# Altium project CONTROL_SSM.PrjPcb
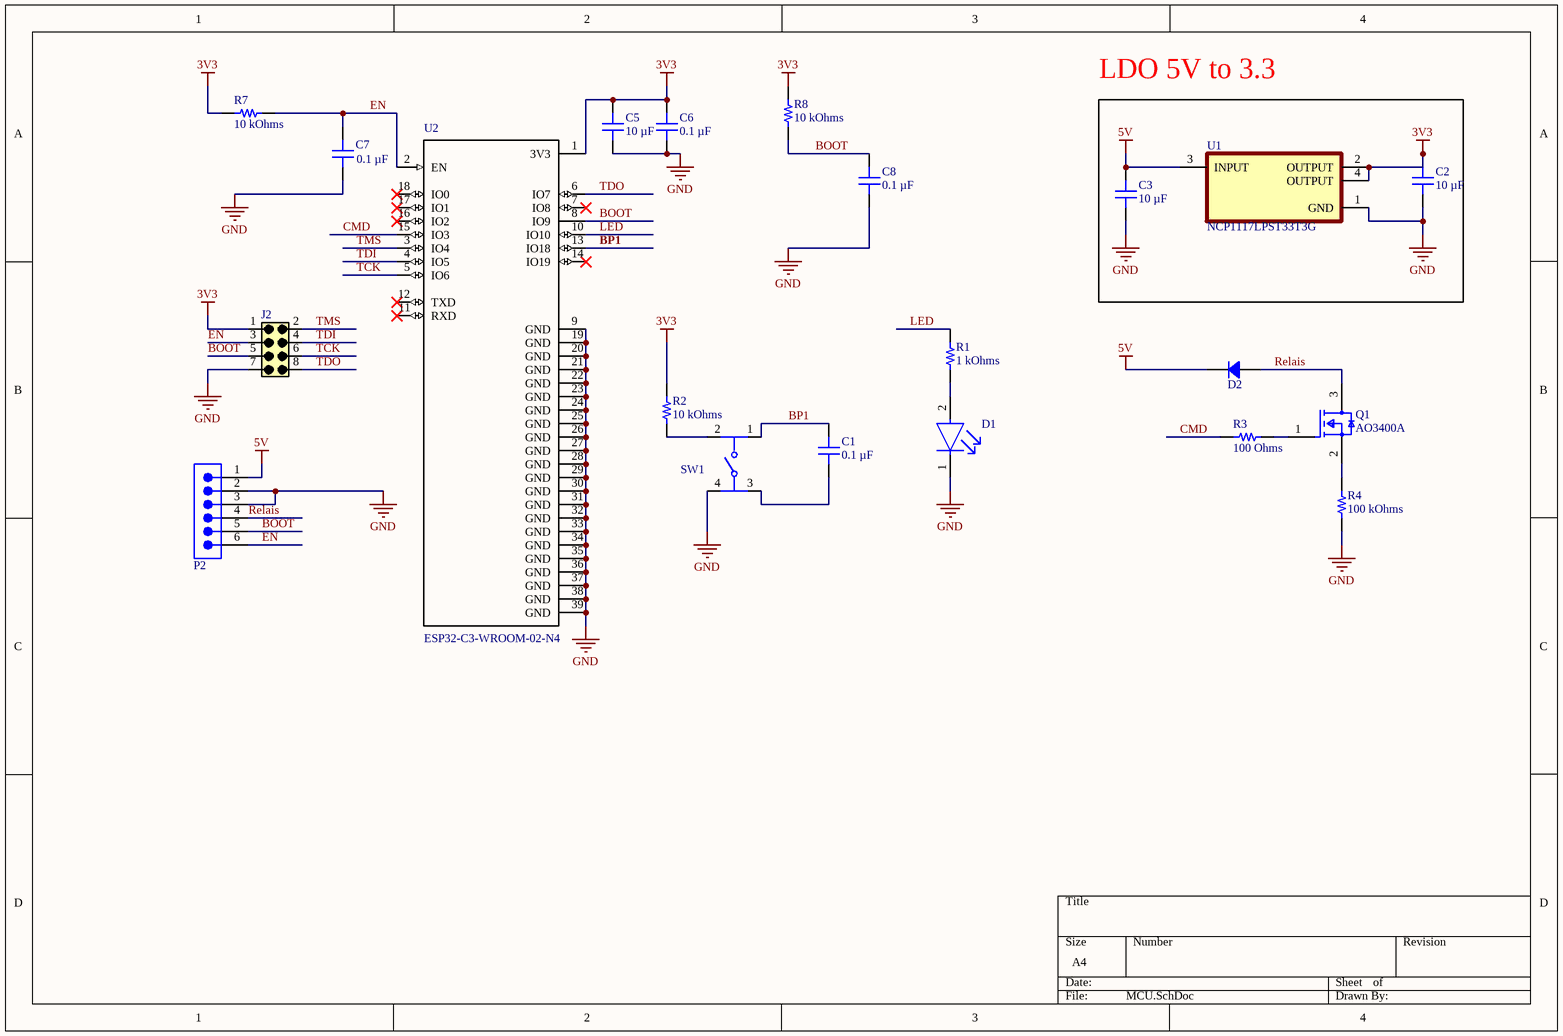
[diagram p0: MCU.SchDoc]
1 sheet, 21 parts. Net scope: global (net labels, ports and power ports of the same name join across sheets).
Board file: PCB_LV.PcbDoc

## Sheet MCU.SchDoc
size A4; SheetNumber: 1; SheetTotal: 1

### Parts
C1  Capacitance: 0.1 µF  [CAP 0402_1005]
C2  10 µF  [CAP 0603_1608]
C3  10 µF  [CAP 0603_1608]
C5  Capacitance: 10 µF  [CAP 0603_1608]
C6  Capacitance: 0.1 µF  [CAP 0402_1005]
C7  Capacitance: 0.1 µF  [CAP 0402_1005]
C8  Capacitance: 0.1 µF  [CAP 0402_1005]
D1  SML-P11DTT86R  [FP-SML-P11-MFG]  (value not drawn)
D2  1N4007FLTR  [SOD123F]  (value not drawn)
J2  6130XX21121_61300821121  [61300821121]  (value not drawn)
P2  TSW-106-08-F-S-RA  [SMTC-TSW-106-08-X-S-RA]  (value not drawn)
Q1  AO3400A  [FP-SOT23-MFG]
R1  1 kOhms  [RES 0402_1005]
R2  10 kOhms  [RES 0402_1005]
R3  100 Ohms  [RES 0402_1005]
R4  100 kOhms  [RES 0402_1005]
R7  10 kOhms  [RES 0402_1005]
R8  10 kOhms  [RES 0402_1005]
SW1  1301.9320  [FP-1301_9320-MFG]  (value not drawn)
U1  NCP1117LPST33T3G  [SOT230P700X175-4N]
U2  ESP32-C3-WROOM-02-N4  [*MODULE_ESP32-C3-WROOM-02-H4]

### Blocks framed on the sheet
LDO 5V to 3.3: C2 C3 U1

### Nets
3V3: C2.2 C5.1 C6.2 J2.1 R2.2 R7.2 R8.2 U1.2(OUTPUT) U1.4(OUTPUT) U2.1(3V3)
5V: C3.2 D2.2 P2.1 U1.3(INPUT)
GND: C2.1 C3.1 C5.2 C6.1 C7.1 C8.1 D1.1(C) J2.7 P2.2 P2.3 R4.1 SW1.4 U1.1(GND) U2.9(GND) U2.19(GND) U2.20(GND) U2.21(GND) U2.22(GND) U2.23(GND) U2.24(GND) U2.25(GND) U2.26(GND) U2.27(GND) U2.28(GND) U2.29(GND) U2.30(GND) U2.31(GND) U2.32(GND) U2.33(GND) U2.34(GND) U2.35(GND) U2.36(GND) U2.37(GND) U2.38(GND) U2.39(GND)
BOOT: C8.2 J2.5 P2.5 R8.1 U2.8(IO9)
BP1: C1.2 SW1.1 U2.13(IO18)
CMD: R3.1 U2.15(IO3)
EN: C7.2 J2.3 P2.6 R7.1 U2.2(EN)
LED: R1.2 U2.10(IO10)
Relais: D2.1 P2.4 Q1.3(D)
TCK: J2.6 U2.5(IO6)
TDI: J2.4 U2.4(IO5)
TDO: J2.8 U2.6(IO7)
TMS: J2.2 U2.3(IO4)
NetC1_1: C1.1 SW1.3
NetD1_2: D1.2(A) R1.1
NetQ1_1: Q1.1(G) R3.2
NetQ1_2: Q1.2(S) R4.2
NetR2_1: R2.1 SW1.2

Not connected (* = marked no-connect by the designer): U2 7(IO8)* 11(RXD)* 12(TXD)* 14(IO19)* 16(IO2)* 17(IO1)* 18(IO0)*

### Library data of the parts
C1 C6-C8 = CC0402MRX5R5BB104: CAP CER 0.1UF 6.3V X5R 0402; Part Number: CC0402MRX5R5BB104
C2 C3 = GMC10X7R106M6R3NT: CAP0603 X7R 10UF 20% 6.3V; manufacturer: Cal-Chip Electronics, Inc.; Part Number: GMC10X7R106M6R3NT; Capacitance: 10 µF; Applications: General Purpose; componentlink1description: Datasheet; componentlink1url: https://88ce57.p3cdn1.secureserver.net/wp-content/uploads/2023/01/gmc_series-2.pdf; componentlink2description: DigiKey Link; componentlink2url: https://www.digikey.com/en/products/detail/cal-chip-electronics-inc/GMC10X7R106M6R3NT/18151153; Device Package: 0603 (1608 Metric); lastupdated: 06/04/2026 7:21:43 PM; Lifecycle Status: Active; Minimum Order: 1; Mounting Type: Surface Mount, MLCC; Operating Temperature: -55°C ~ 125°C; Package / Case: 0603 (1608 Metric); packaging: TapeAndReel; partid: 49831; Part Status: Active; price: 0.09; series: GMC; Size / Dimension: 0.063" L x 0.031" W (1.60mm x 0.80mm); Supplier 1: DigiKey; Supplier Part Number 1: 4713-GMC10X7R106M6R3NTCT-ND; Temperature Coefficient: X7R; Thickness (Max): 0.039" (1.00mm); Tolerance: ±20%; value: 10 µF; Voltage - Rated: 6.3V
C5 = GRT188R61A106KE13D: CAP CER 10UF 10V X5R 0603; Part Number: GRT188R61A106KE13D
D1 = CMP-08952-000022-1: LED ORANGE CLEAR 1006 SMD; Manufacturer: Rohm; Forward Current: 1mA; Wavelength: 605nm; Reverse Voltage: 5V; Power Dissipation: 52mW; Led Orientation: Top View; Luminous Intensity: 7.3mcd; Forward Voltage: 1.9V; Mouser Description: LED Uni-Color Orange 2-Pin Chip 0402(1006Metric) T/R; RoHS: TRUE; Temperature: -40°C to +85°C; Package: SML-P11; Manufacturer Part Number: SML-P11DTT86R; Automotive: No; Digikey Description: LED ORANGE CLEAR 1006 SMD; Lead Free: Yes; Octopart: https://octopart.com/sml-p11dtt86r-rohm-34112313; Temperature Range Low: -40°C; Device Class L2: LEDs; Device Class L3: unset; Height: 0.25mm; Temperature Range High: +85°C; Device Class L1: Optoelectronics; ComponentLink2URL: https://d1d2qsbl8m0m72.cloudfront.net/en/products/databook/datasheet/opto/led/chip_mono/sml-p11-e.pdf; Colour: Orange; Category: Diode; ComponentLink2Description: Datasheet
D2 = 1N4007FLTR: STANDARD RECTIFIER 1000V SOD-123; Part Number: 1N4007FLTR
J2 = 6130XX21121_61300821121: Connector Header Through Hole 8 position 0.100 (2.54mm); MF: Wurth Electronics; SnapEDA_Link: https://www.snapeda.com/parts/61300821121/Wurth+Electronics/view-part/?ref=snap; Package: None; Value: *; MP: 61300821121; Check_prices: https://www.snapeda.com/parts/61300821121/Wurth+Electronics/view-part/?ref=eda
P2 = CMP-1024-00389-1: 0.025" SQ Post Header, Through-hole, Right Angle, -55 to 125 degC, 2.54 mm Pitch, 6-Pin, Male, RoHS; Manufacturer: Samtec; Pitch: 2.54 mm; System: Connector; DatasheetVersion: F-214; PartNumber: TSW-106-08-F-S-RA; PackageDescription: .025[0.64] SQ. Post Terminal Strip Assembly; ComponentLink1Description: Manufacturer URL; ComponentLink2Description: Datasheet; PackageReference: TSW-106-08-X-S-RA; Mounting Technology: Through-hole; ComponentLink1URL: http://www.samtec.com; ComponentLink2URL: http://www.samtec.com/documents/webfiles/pdf/TSW_TH.PDF; Orientation: Right Angle; ComponentLink3URL: http://www.samtec.com/documents/webfiles/cpdf/TSW-XXX-XX-XXX-X-XX-XXX-MKT.pdf; PackageVersion: DM, 8/1988; Temperature Range: -55 to 125 degC; RoHS: True; ComponentLink3Description: Package Specification
Q1 = CMP-83955-000006-1: MOSFET N-CH 30V 5.7A SOT23; Input Capacitance: 630pF; Number of Elements: 1; Rds On Max: 26.5mR; Max Power Dissipation: 1.4W; Gate to Source Voltage (Vgs): 12V; Min Operating Temperature: -55°C; Lead Free: Lead Free; Number of Pins: 3; Drain to Source Voltage (Vdss): 30V; Case/Package: SOT-23; Mount: Surface Mount; Continuous Drain Current (ID): 5.7A; Radiation Hardening: No; Packaging: Tape and Reel; Max Operating Temperature: 150°C; Power Dissipation: 1.4W
R1 = TNPU04021K00BZEP00: TNPU0402 1K0 0.1% T-16 EP1 E3; Manufacturer: Vishay Dale; Power (Watts): 0.063W, 1/16W; Temperature Coefficient: ±5ppm/°C; Part Number: TNPU04021K00BZEP00; Value: 1 kOhms; ComponentLink1Description: Datasheet; ComponentLink1URL: http://www.vishay.com/docs/28779/tnpue3.pdf; ComponentLink2Description: DigiKey Link; ComponentLink2URL: https://www.digikey.com/en/products/detail/vishay-dale/TNPU04021K00BZEP00/10668523; Composition: Thin Film; Device Package: 0402 (1005 Metric); Features: Anti-Sulfur, Automotive AEC-Q200, Moisture Resistant; Height - Seated (Max): 0.016" (0.40mm); LastUpdated: 09/02/2024 8:29:39 PM; Lifecycle Status: Active; Minimum Order: 1; Number of Terminations: 2; Operating Temperature: -55°C ~ 125°C; Package / Case: 0402 (1005 Metric); Packaging: TapeAndReel; PartId: 49940; Part Status: Active; Price: 0.67; Ratings: AEC-Q200; Resistance: 1 kOhms; Series: TNPU e3; Size / Dimension: 0.039" L x 0.020" W (1.00mm x 0.50mm); Supplier 1: DigiKey; Supplier Part Number 1: 541-TNPU04021K00BZEP00CT-ND; Supplier Device Package: 0402; Tolerance: ±0.1%
R2 R7 R8 = TNPU040210K0BZEP00: TNPU0402 10K 0.1% T-16 EP1 E3; Part Number: TNPU040210K0BZEP00; Value: 10 kOhms
R3 = TNPU0402100RBZEP00: TNPU0402 100R 0.1% T-16 EP1 E3; Part Number: TNPU0402100RBZEP00; Value: 100 Ohms
R4 = TNPU0402100KBZEP00: TNPU0402 100K 0.1% T-16 EP1 E3; Part Number: TNPU0402100KBZEP00; Value: 100 kOhms
SW1 = CMP-26321-000001-1: SWITCH TACTILE SPST-NO 0.05A 12V; Manufacturer: Schurter; Electromechanical Life: 100000Cycles; Contact Current Rating: 50mA; Contact Resistance: 100mΩ; Operating Force: 1.6N; Height: 12.5mm; ComponentLink2Description: Datasheet; Temperature Range Low: -20°C; Device Class L1: Electromechanical; Voltage Rating Dc: 12V; Device Class L3: Tactile Switches; Throw Configuration: SPST-NO; ComponentLink2URL: https://www.schurter.com/en/datasheet/typ_6x6_mm_tact_switches.pdf; Lead Free: Yes; Temperature: -20°C to +70°C; Manufacturer Part Number: 1301.9320; Mount: Surface Mount; Digikey Description: SWITCH TACTILE SPST-NO 0.05A 12V; Device Class L2: Switches; Temperature Range High: +70°C; Category: Switch; RoHS: TRUE; Automotive: No; Octopart: https://octopart.com/1301.9320-schurter-6627962; Package: 0
U1 = NCP1117LPST33T3G: Linear Voltage Regulator IC Positive Fixed 1 Output 1A SOT-223; MF: ON Semiconductor; SnapEDA_Link: https://www.snapeda.com/parts/NCP1117LPST33T3G/Onsemi/view-part/?ref=snap; Package: SOT-223-4 ON Semiconductor; Value: *; MP: NCP1117LPST33T3G; Check_prices: https://www.snapeda.com/parts/NCP1117LPST33T3G/Onsemi/view-part/?ref=eda
U2 = ESP32-C3-WROOM-02-N4: WiFi Modules (802.11) (Engineering Samples) SMD module, ESP32-C3, 4MB SPI flash, PCB antenna, -40 C +85 C; MF: Espressif Systems; Package: Package; Price: None; Check_prices: https://www.snapeda.com/parts/ESP32-C3-WROOM-02-N4/Espressif+Systems/view-part/?ref=eda; SnapEDA_Link: https://www.snapeda.com/parts/ESP32-C3-WROOM-02-N4/Espressif+Systems/view-part/?ref=snap; MP: ESP32-C3-WROOM-02-N4; Availability: In Stock; Purchase-URL: https://www.snapeda.com/api/url_track_click_mouser/?unipart_id=5683419&manufacturer=Espressif Systems&part_name=ESP32-C3-WROOM-02-N4&search_term=esp32-c3-wroom-02; Value: *